# Altium schematic sheet Electrode_35x30_5x6_D2p5.SchDoc
size A; SheetNumber: 1; SheetTotal: 1
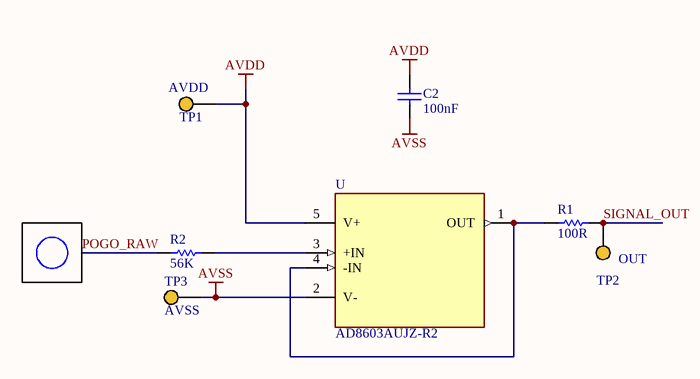
[diagram p0: Electrode_35x30_5x6_D2p5.SchDoc]

## Parts
C2  Value1: 100nF  [C0402L]
R1  100R  [R0402L]
R2  56K  [R0402L]
TP1  AVDD  [TESTPOINT 1.2MM]  (no BOM)
TP2  OUT  [TESTPOINT 1.2MM]  (no BOM)
TP3  AVSS  [TESTPOINT 1.2MM]  (no BOM)
U  AD8603AUJZ-R2  [SOT95P280X100-5N]

## Nets
AVDD: C2.1 TP1.1 U.5(V+)
AVSS: C2.2 TP3.1 U.2(V-)
POGO_RAW: R2.1
SIGNAL_OUT: R1.2 TP2.1
NetR1_1: R1.1 U.1(OUT) U.4(-IN)
NetR2_2: R2.2 U.3(+IN)

## Library data of the parts
C2 = C0402_1: CAP 0402 100nF 16V Y5V; MPN: CL05B104KO5NNNC; Manu: Samsung Electro-Mechanics; Comment Description: Cap 0.1uF 16V 0402; Type: Capacitor; Value2: 16V
R1 R2 = R0402_4_1: MPN: FRC0603J2R0 TS; Value1: 2R; Value2: 100mW; Comment Description: 2Ω ±5% 100mW 0603 Thick Film Resistor; Manu: FOJAN; Case: 0603; Type: Resistor
TP1-TP3 = Test point: Value1: N/A; Value2: N/A
U = AD8603AUJZ-R2: General Purpose Amplifier 1 Circuit Rail-to-Rail TSOT-5; MF: Analog Devices; Value: *; Availability: Unavailable; Price: None; MP: AD8603AUJZ-R2; Package: TSOT-5 Analog Devices; SnapEDA_Link: https://www.snapeda.com/parts/AD8603AUJZ-R2/Analog%20Devices/view-part/574456/?ref=snap